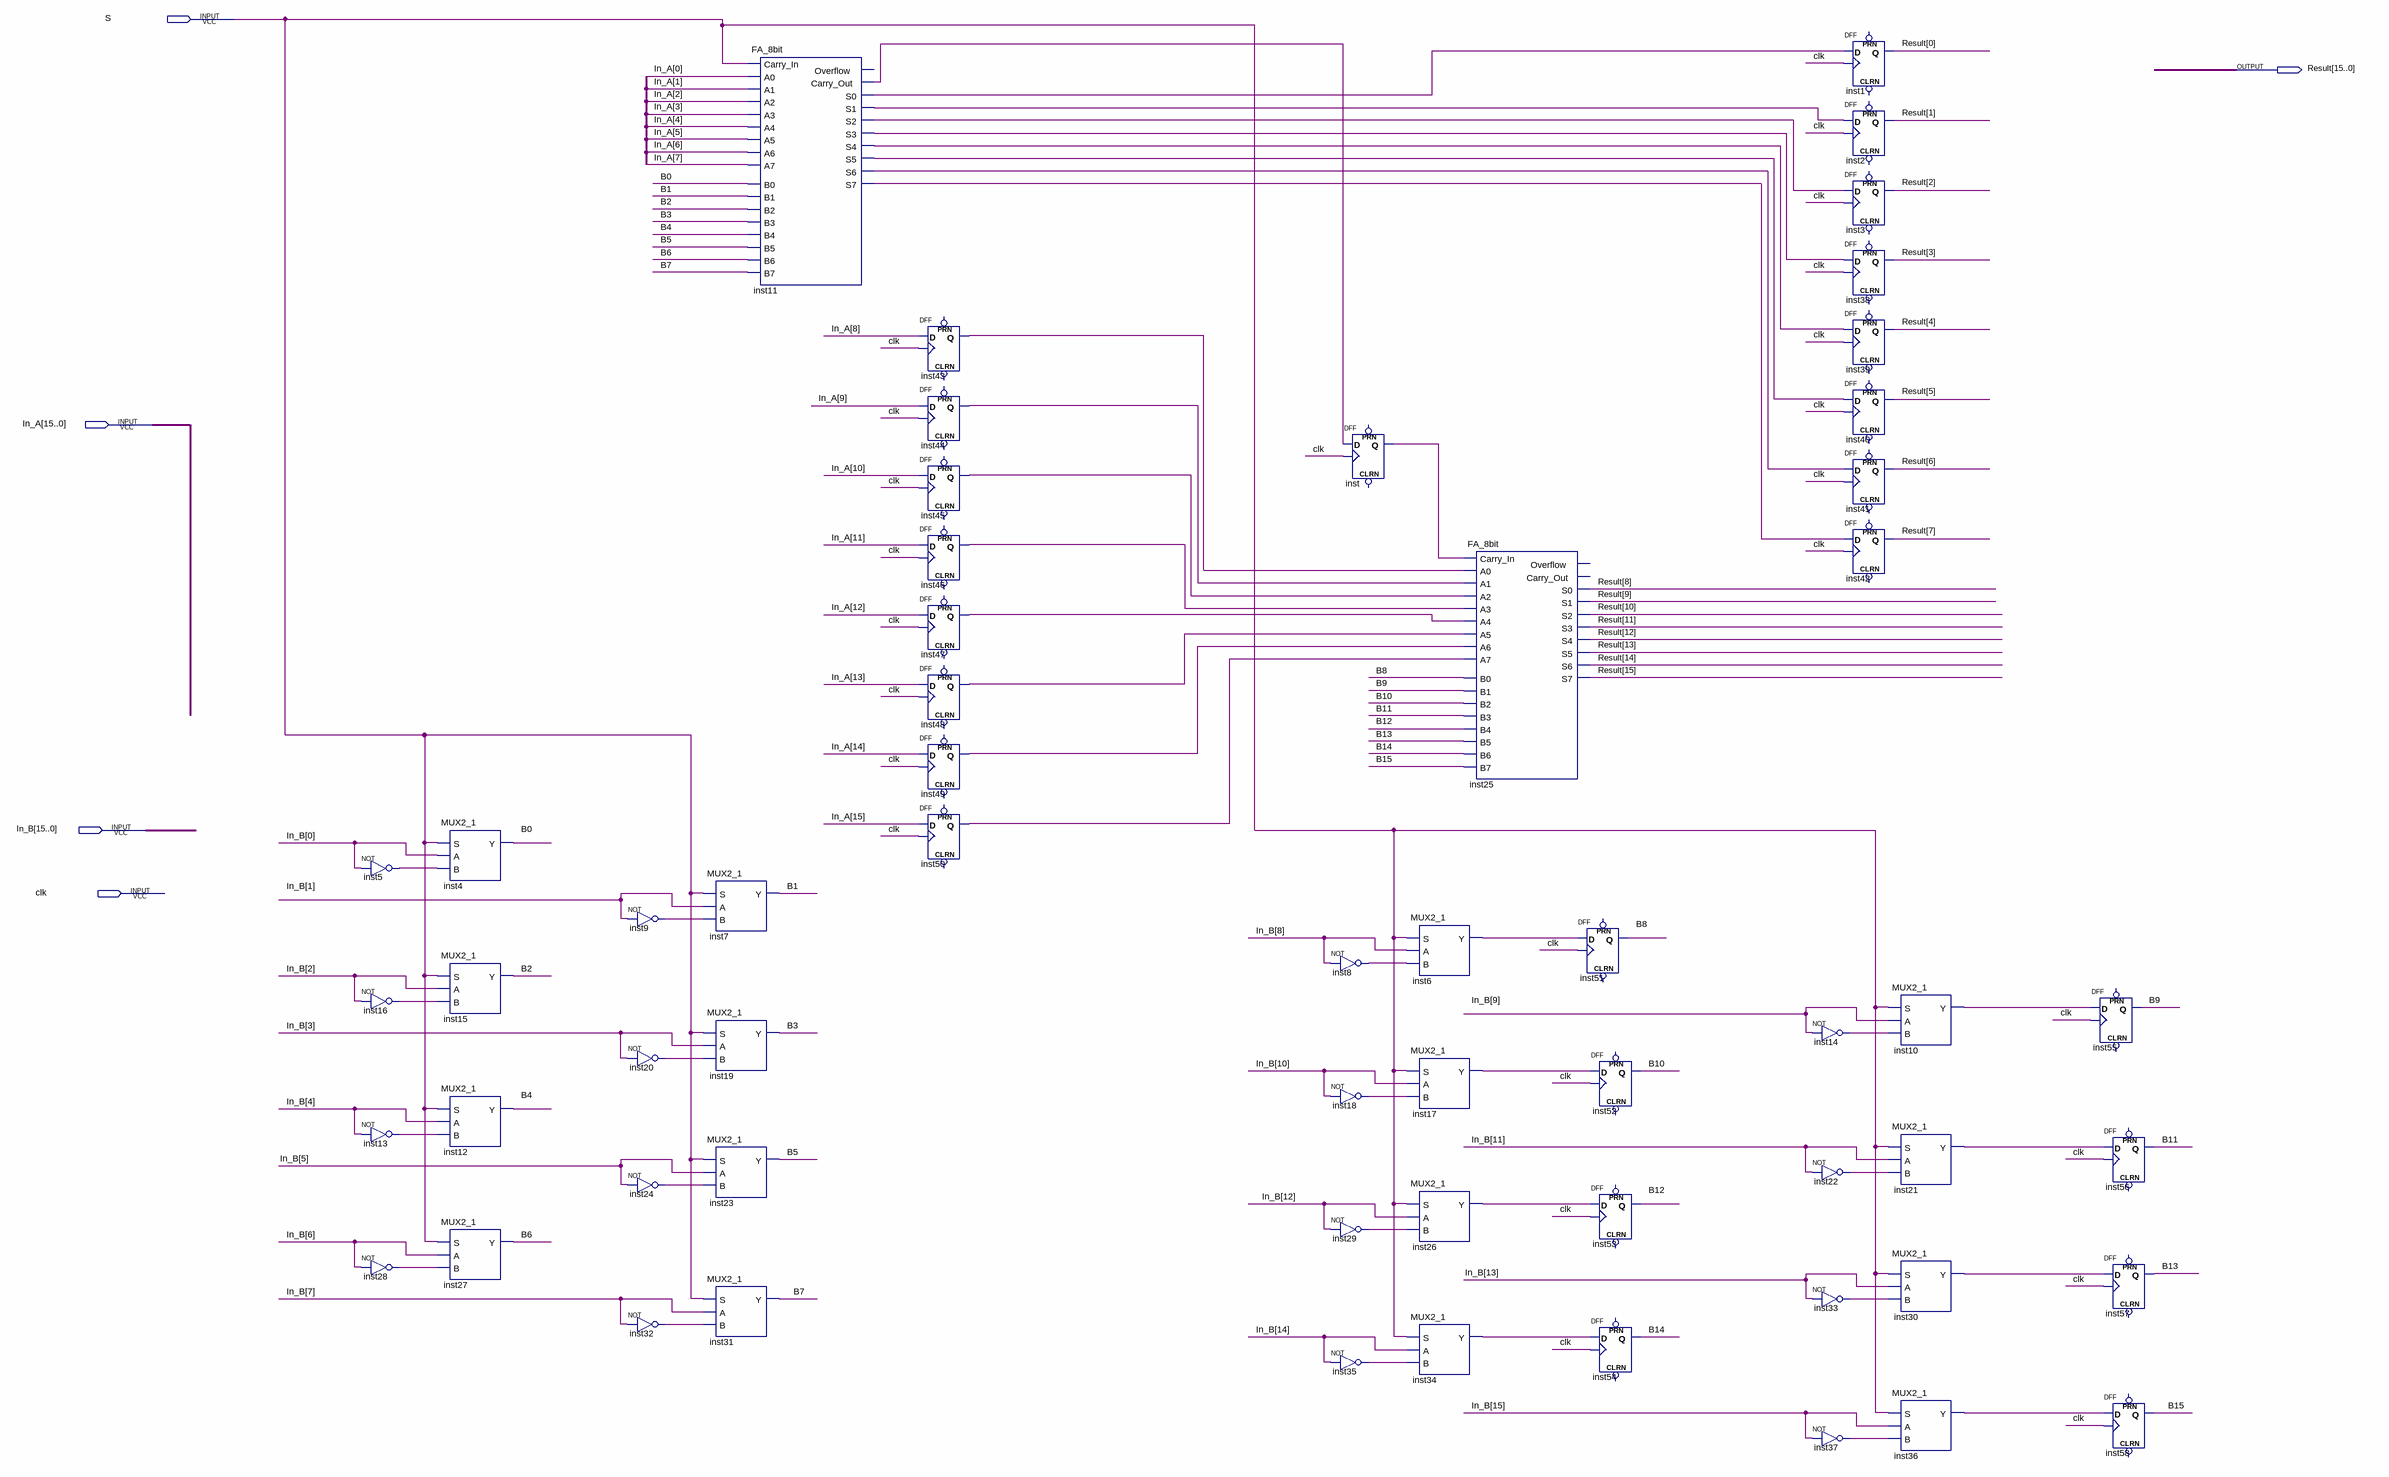
[diagram p0: schematic sheet]
// Quartus schematic Add_Sub_16bit_Pipeline_2Stage.bdf as structural Verilog: 59 symbols, 5 pins
module Add_Sub_16bit_Pipeline_2Stage (
  input  S,
  input  [15:0] In_A,
  input  [15:0] In_B,
  input  clk,
  output [15:0] Result
);

  wire B0, B1, B2, B3, B4, B5, B6, B7, B8, B9, B10, B11, B12, B13, B14, B15, inst5_out, inst6_y, inst8_out,
       inst9_out, inst10_y, inst11_carry_out, inst11_s0, inst11_s1, inst11_s2, inst11_s3, inst11_s4,
       inst11_s5, inst11_s6, inst11_s7, inst13_out, inst14_out, inst16_out, inst17_y, inst18_out, inst20_out,
       inst21_y, inst22_out, inst24_out, inst26_y, inst28_out, inst29_out, inst30_y, inst32_out, inst33_out,
       inst34_y, inst35_out, inst36_y, inst37_out, inst43_q, inst44_q, inst45_q, inst46_q, inst47_q,
       inst48_q, inst49_q, inst50_q, inst_q;

  not inst5 (inst5_out, In_B[0]);
  not inst16 (inst16_out, In_B[2]);
  not inst13 (inst13_out, In_B[4]);
  not inst28 (inst28_out, In_B[6]);
  MUX2_1 inst4 (.S(S), .A(In_B[0]), .B(inst5_out), .Y(B0));
  MUX2_1 inst15 (.S(S), .A(In_B[2]), .B(inst16_out), .Y(B2));
  MUX2_1 inst12 (.S(S), .A(In_B[4]), .B(inst13_out), .Y(B4));
  MUX2_1 inst27 (.S(S), .A(In_B[6]), .B(inst28_out), .Y(B6));
  not inst9 (inst9_out, In_B[1]);
  not inst20 (inst20_out, In_B[3]);
  not inst24 (inst24_out, In_B[5]);
  not inst32 (inst32_out, In_B[7]);
  MUX2_1 inst7 (.S(S), .A(In_B[1]), .B(inst9_out), .Y(B1));
  MUX2_1 inst19 (.S(S), .A(In_B[3]), .B(inst20_out), .Y(B3));
  MUX2_1 inst23 (.S(S), .A(In_B[5]), .B(inst24_out), .Y(B5));
  MUX2_1 inst31 (.S(S), .A(In_B[7]), .B(inst32_out), .Y(B7));
  FA_8bit inst11 (
    .A0(In_A[0]), .B0(B0), .B1(B1), .A1(In_A[1]), .B2(B2), .A2(In_A[2]), .B3(B3), .A3(In_A[3]), .A4(In_A[4]),
    .B4(B4), .B5(B5), .A5(In_A[5]), .B6(B6), .A6(In_A[6]), .B7(B7), .A7(In_A[7]), .Carry_In(S),
    .Carry_Out(inst11_carry_out), .S0(inst11_s0), .S1(inst11_s1), .S2(inst11_s2), .S3(inst11_s3),
    .S4(inst11_s4), .S5(inst11_s5), .S6(inst11_s6), .S7(inst11_s7));  // open: Overflow
  DFF inst43 (.CLK(clk), .D(In_A[8]), .Q(inst43_q));  // open: CLRN, PRN
  DFF inst44 (.CLK(clk), .D(In_A[9]), .Q(inst44_q));  // open: CLRN, PRN
  DFF inst45 (.CLK(clk), .D(In_A[10]), .Q(inst45_q));  // open: CLRN, PRN
  DFF inst46 (.CLK(clk), .D(In_A[11]), .Q(inst46_q));  // open: CLRN, PRN
  DFF inst47 (.CLK(clk), .D(In_A[12]), .Q(inst47_q));  // open: CLRN, PRN
  DFF inst48 (.CLK(clk), .D(In_A[13]), .Q(inst48_q));  // open: CLRN, PRN
  DFF inst49 (.CLK(clk), .D(In_A[14]), .Q(inst49_q));  // open: CLRN, PRN
  DFF inst50 (.CLK(clk), .D(In_A[15]), .Q(inst50_q));  // open: CLRN, PRN
  not inst8 (inst8_out, In_B[8]);
  not inst18 (inst18_out, In_B[10]);
  not inst29 (inst29_out, In_B[12]);
  not inst35 (inst35_out, In_B[14]);
  DFF inst (.CLK(clk), .D(inst11_carry_out), .Q(inst_q));  // open: CLRN, PRN
  MUX2_1 inst6 (.S(S), .A(In_B[8]), .B(inst8_out), .Y(inst6_y));
  MUX2_1 inst17 (.S(S), .A(In_B[10]), .B(inst18_out), .Y(inst17_y));
  MUX2_1 inst26 (.S(S), .A(In_B[12]), .B(inst29_out), .Y(inst26_y));
  MUX2_1 inst34 (.S(S), .A(In_B[14]), .B(inst35_out), .Y(inst34_y));
  FA_8bit inst25 (
    .A0(inst43_q), .B0(B8), .B1(B9), .A1(inst44_q), .B2(B10), .A2(inst45_q), .B3(B11), .A3(inst46_q),
    .A4(inst47_q), .B4(B12), .B5(B13), .A5(inst48_q), .B6(B14), .A6(inst49_q), .B7(B15), .A7(inst50_q),
    .Carry_In(inst_q), .S0(Result[8]), .S1(Result[9]), .S2(Result[10]), .S3(Result[11]), .S4(Result[12]),
    .S5(Result[13]), .S6(Result[14]), .S7(Result[15]));  // open: Overflow, Carry_Out
  DFF inst51 (.CLK(clk), .D(inst6_y), .Q(B8));  // open: CLRN, PRN
  DFF inst52 (.CLK(clk), .D(inst17_y), .Q(B10));  // open: CLRN, PRN
  DFF inst53 (.CLK(clk), .D(inst26_y), .Q(B12));  // open: CLRN, PRN
  DFF inst54 (.CLK(clk), .D(inst34_y), .Q(B14));  // open: CLRN, PRN
  not inst14 (inst14_out, In_B[9]);
  not inst22 (inst22_out, In_B[11]);
  not inst33 (inst33_out, In_B[13]);
  not inst37 (inst37_out, In_B[15]);
  DFF inst1 (.CLK(clk), .D(inst11_s0), .Q(Result[0]));  // open: CLRN, PRN
  DFF inst2 (.CLK(clk), .D(inst11_s1), .Q(Result[1]));  // open: CLRN, PRN
  DFF inst3 (.CLK(clk), .D(inst11_s2), .Q(Result[2]));  // open: CLRN, PRN
  DFF inst38 (.CLK(clk), .D(inst11_s3), .Q(Result[3]));  // open: CLRN, PRN
  DFF inst39 (.CLK(clk), .D(inst11_s4), .Q(Result[4]));  // open: CLRN, PRN
  DFF inst40 (.CLK(clk), .D(inst11_s5), .Q(Result[5]));  // open: CLRN, PRN
  DFF inst41 (.CLK(clk), .D(inst11_s6), .Q(Result[6]));  // open: CLRN, PRN
  DFF inst42 (.CLK(clk), .D(inst11_s7), .Q(Result[7]));  // open: CLRN, PRN
  MUX2_1 inst10 (.S(S), .A(In_B[9]), .B(inst14_out), .Y(inst10_y));
  MUX2_1 inst21 (.S(S), .A(In_B[11]), .B(inst22_out), .Y(inst21_y));
  MUX2_1 inst30 (.S(S), .A(In_B[13]), .B(inst33_out), .Y(inst30_y));
  MUX2_1 inst36 (.S(S), .A(In_B[15]), .B(inst37_out), .Y(inst36_y));
  DFF inst55 (.CLK(clk), .D(inst10_y), .Q(B9));  // open: CLRN, PRN
  DFF inst56 (.CLK(clk), .D(inst21_y), .Q(B11));  // open: CLRN, PRN
  DFF inst57 (.CLK(clk), .D(inst30_y), .Q(B13));  // open: CLRN, PRN
  DFF inst58 (.CLK(clk), .D(inst36_y), .Q(B15));  // open: CLRN, PRN
endmodule
